# Altium schematic sheet MD040_Motor_control_RevE2.SchDoc
size 431 x 279 mm; Date: Not shown in title block; ApprovedBy: Not shown in title block; CheckedBy: Not shown in title block; Author: Not shown in title block; CompanyName: Not shown in title block; Engineer: Not shown in title block; Organization: Not shown in title block; Address1: Not shown in title block; Address2: Not shown in title block; Address3: Not shown in title block; Address4: Not shown in title block; DocumentNumber: 2; Revision: Use project parameter SCH_Rev; SheetNumber: 2; SheetTotal: 3; PageSetup: Record=PageOptions|CenterHorizontal=True|CenterVertical=True|PrintScale=1.00|XCorrection=1.00|YCorrection=1.00|PrintKind=0|BorderSize=5000000|LeftOffset=0|BottomOffset=0|Orientation=2|PaperLength=1000|PaperWidth=1000|Scale=100|PaperSource=15|PrintQuality=600|MediaType=1|DitherType=10|PaperKind=Letter|PrintScaleMode=1; CurrentTime: Not shown in title block; CurrentDate: Not shown in title block; Time: Not shown in title block; DocumentFullPathAndName: Not shown in title block; DocumentName: Not shown in title block; ModifiedDate: Not shown in title block; ImagePath: Not shown in title block
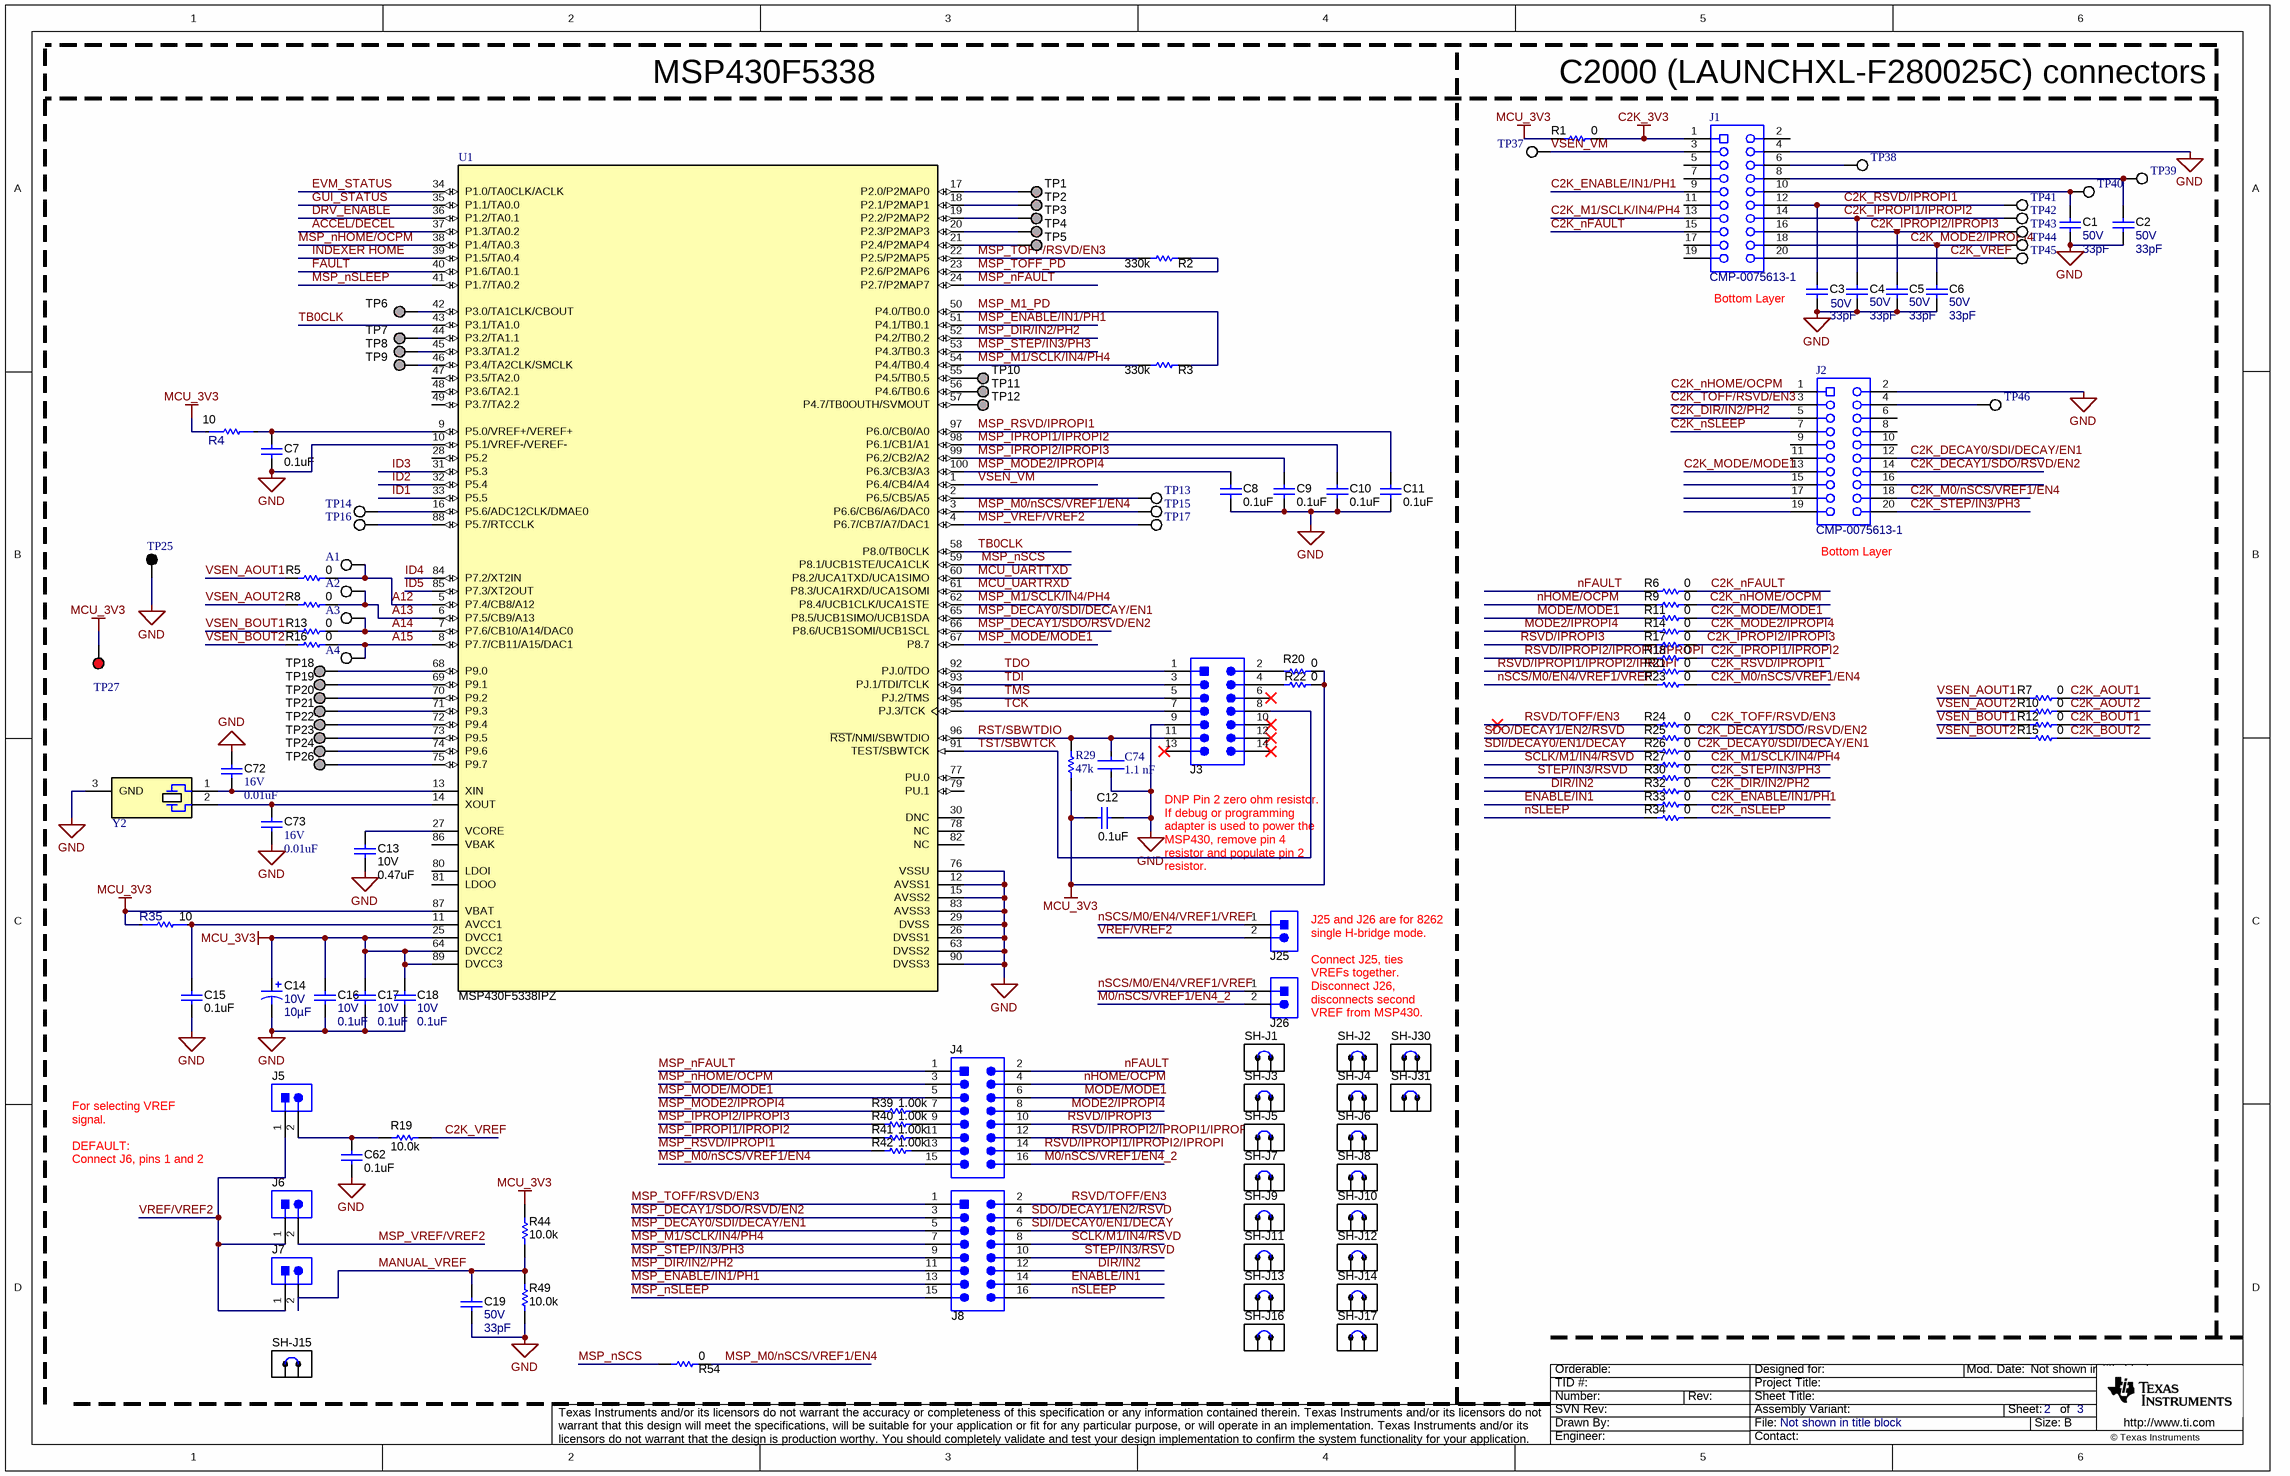
[diagram p0: MD040_Motor_control_RevE2.SchDoc]

## Parts
A1  5012  [Keystone5012]  (value not drawn)
A2  5012  [Keystone5012]  (value not drawn)
A3  5012  [Keystone5012]  (value not drawn)
A4  5012  [Keystone5012]  (value not drawn)
C1  VDC_V: 50V  ValueDisplayed: 33pF  [0402]  (hidden comment: C1005C0G1H330J050BA)
C2  VDC_V: 50V  ValueDisplayed: 33pF  [0402]  (hidden comment: C1005C0G1H330J050BA)
C3  VDC_V: 50V  ValueDisplayed: 33pF  [0402]  (hidden comment: C1005C0G1H330J050BA)
C4  VDC_V: 50V  ValueDisplayed: 33pF  [0402]  (hidden comment: C1005C0G1H330J050BA)
C5  VDC_V: 50V  ValueDisplayed: 33pF  [0402]  (hidden comment: C1005C0G1H330J050BA)
C6  VDC_V: 50V  ValueDisplayed: 33pF  [0402]  (hidden comment: C1005C0G1H330J050BA)
C7  ValueDisplayed: 0.1uF  [0402L]  (hidden comment: 885012105010)
C8  ValueDisplayed: 0.1uF  [0402L]  (hidden comment: 885012105010)
C9  ValueDisplayed: 0.1uF  [0402L]  (hidden comment: 885012105010)
C10  ValueDisplayed: 0.1uF  [0402L]  (hidden comment: 885012105010)
C11  ValueDisplayed: 0.1uF  [0402L]  (hidden comment: 885012105010)
C12  ValueDisplayed: 0.1uF  [0402L]  (hidden comment: 885012105010)
C13  VDC_V: 10V  ValueDisplayed: 0.47uF  [0402]  (hidden comment: GRM155R61A474KE15D)
C14  VDC_V: 10V  ValueDisplayed: 10µF  [3216-18]  (hidden comment: T520A106M010ATE080)
C15  ValueDisplayed: 0.1uF  [0402L]  (hidden comment: 885012105010)
C16  VDC_V: 10V  ValueDisplayed: 0.1uF  [0402]  (hidden comment: GRM155R61A104KA01D)
C17  VDC_V: 10V  ValueDisplayed: 0.1uF  [0402]  (hidden comment: GRM155R61A104KA01D)
C18  VDC_V: 10V  ValueDisplayed: 0.1uF  [0402]  (hidden comment: GRM155R61A104KA01D)
C19  VDC_V: 50V  ValueDisplayed: 33pF  [0402]  (hidden comment: C1005C0G1H330J050BA)
C62  ValueDisplayed: 0.1uF  [0402L]  (hidden comment: 885012105010)
C72  VDC_V: 16V  ValueDisplayed: 0.01uF  [0402]  (hidden comment: 885012205031)
C73  VDC_V: 16V  ValueDisplayed: 0.01uF  [0402]  (hidden comment: 885012205031)
C74  1.1 nF  [FP-C0805C-DN-MFG]
J1  CMP-0075613-1  [Samtec_SSQ-110-03-x-D]
J2  CMP-0075613-1  [Samtec_SSQ-110-03-x-D]
J3  Header_7x2_PEC07DAAN  [CONN_PEC07DAAN]  (value not drawn)
J4  TSM-108-01-L-DV  [Samtec_TSM-108-01-x-DV]  (value not drawn)
J5  PBC02SAAN  [Sullins_PBC02SAAN]  (value not drawn)
J6  PBC02SAAN  [Sullins_PBC02SAAN]  (value not drawn)
J7  PBC02SAAN  [Sullins_PBC02SAAN]  (value not drawn)
J8  TSM-108-01-L-DV  [Samtec_TSM-108-01-x-DV]  (value not drawn)
J25  PBC02SAAN  [Sullins_PBC02SAAN]  (value not drawn)
J26  PBC02SAAN  [Sullins_PBC02SAAN]  (value not drawn)
R1  value 0  [0402L]  (hidden comment: Resistor)
R2  ValueDisplayed: 330k  [0603L]  (hidden comment: CRCW0603330KJNEA)
R3  ValueDisplayed: 330k  [0603L]  (hidden comment: CRCW0603330KJNEA)
R4  Res_ohm: 10  [FP-CH0402-10RJFPT_0402-MFG]  (hidden comment: CH0402-10RJFPT)
R5  value 0  [0402L]  (hidden comment: Resistor)
R6  value 0  [0402L]  (hidden comment: Resistor)
R7  value 0  [0402L]  (hidden comment: Resistor)
R8  value 0  [0402L]  (hidden comment: Resistor)
R9  value 0  [0402L]  (hidden comment: Resistor)
R10  value 0  [0402L]  (hidden comment: Resistor)
R11  value 0  [0402L]  (hidden comment: Resistor)
R12  value 0  [0402L]  (hidden comment: Resistor)
R13  value 0  [0402L]  (hidden comment: Resistor)
R14  value 0  [0402L]  (hidden comment: Resistor)
R15  value 0  [0402L]  (hidden comment: Resistor)
R16  value 0  [0402L]  (hidden comment: Resistor)
R17  value 0  [0402L]  (hidden comment: Resistor)
R18  value 0  [0402L]  (hidden comment: Resistor)
R19  ValueDisplayed: 10.0k  [0603]  (hidden comment: CRCW060310K0FKEA)
R20  value 0  [0402L]  (hidden comment: Resistor)
R21  value 0  [0402L]  (hidden comment: Resistor)
R22  value 0  [0402L]  (hidden comment: Resistor)
R23  value 0  [0402L]  (hidden comment: Resistor)
R24  value 0  [0402L]  (hidden comment: Resistor)
R25  value 0  [0402L]  (hidden comment: Resistor)
R26  value 0  [0402L]  (hidden comment: Resistor)
R27  value 0  [0402L]  (hidden comment: Resistor)
R29  47k  [RESC1005X40X25ML05T10]
R30  value 0  [0402L]  (hidden comment: Resistor)
R32  value 0  [0402L]  (hidden comment: Resistor)
R33  value 0  [0402L]  (hidden comment: Resistor)
R34  value 0  [0402L]  (hidden comment: Resistor)
R35  Res_ohm: 10  [FP-CH0402-10RJFPT_0402-MFG]  (hidden comment: CH0402-10RJFPT)
R39  ValueDisplayed: 1.00k  [0402L]  (hidden comment: CRCW04021K00FKED)
R40  ValueDisplayed: 1.00k  [0402L]  (hidden comment: CRCW04021K00FKED)
R41  ValueDisplayed: 1.00k  [0402L]  (hidden comment: CRCW04021K00FKED)
R42  ValueDisplayed: 1.00k  [0402L]  (hidden comment: CRCW04021K00FKED)
R44  ValueDisplayed: 10.0k  [0603]  (hidden comment: CRCW060310K0FKEA)
R49  ValueDisplayed: 10.0k  [0603]  (hidden comment: CRCW060310K0FKEA)
R54  value 0  [0402L]  (hidden comment: Resistor)
SH-J1  SNT-100-BK-G  [SNT-100-BK-G]  (value not drawn)
SH-J2  SNT-100-BK-G  [SNT-100-BK-G]  (value not drawn)
SH-J3  SNT-100-BK-G  [SNT-100-BK-G]  (value not drawn)
SH-J4  SNT-100-BK-G  [SNT-100-BK-G]  (value not drawn)
SH-J5  SNT-100-BK-G  [SNT-100-BK-G]  (value not drawn)
SH-J6  SNT-100-BK-G  [SNT-100-BK-G]  (value not drawn)
SH-J7  SNT-100-BK-G  [SNT-100-BK-G]  (value not drawn)
SH-J8  SNT-100-BK-G  [SNT-100-BK-G]  (value not drawn)
SH-J9  SNT-100-BK-G  [SNT-100-BK-G]  (value not drawn)
SH-J10  SNT-100-BK-G  [SNT-100-BK-G]  (value not drawn)
SH-J11  SNT-100-BK-G  [SNT-100-BK-G]  (value not drawn)
SH-J12  SNT-100-BK-G  [SNT-100-BK-G]  (value not drawn)
SH-J13  SNT-100-BK-G  [SNT-100-BK-G]  (value not drawn)
SH-J14  SNT-100-BK-G  [SNT-100-BK-G]  (value not drawn)
SH-J15  SNT-100-BK-G  [SNT-100-BK-G]  (value not drawn)
SH-J16  SNT-100-BK-G  [SNT-100-BK-G]  (value not drawn)
SH-J17  SNT-100-BK-G  [SNT-100-BK-G]  (value not drawn)
SH-J30  SNT-100-BK-G  [SNT-100-BK-G]  (value not drawn)
SH-J31  SNT-100-BK-G  [SNT-100-BK-G]  (value not drawn)
TP1  TP_H0.45P0.75  [TP_H045P075]  (value not drawn)  (no BOM)
TP2  TP_H0.45P0.75  [TP_H045P075]  (value not drawn)  (no BOM)
TP3  TP_H0.45P0.75  [TP_H045P075]  (value not drawn)  (no BOM)
TP4  TP_H0.45P0.75  [TP_H045P075]  (value not drawn)  (no BOM)
TP5  TP_H0.45P0.75  [TP_H045P075]  (value not drawn)  (no BOM)
TP6  TP_H0.45P0.75  [TP_H045P075]  (value not drawn)  (no BOM)
TP7  TP_H0.45P0.75  [TP_H045P075]  (value not drawn)  (no BOM)
TP8  TP_H0.45P0.75  [TP_H045P075]  (value not drawn)  (no BOM)
TP9  TP_H0.45P0.75  [TP_H045P075]  (value not drawn)  (no BOM)
TP10  TP_H0.45P0.75  [TP_H045P075]  (value not drawn)  (no BOM)
TP11  TP_H0.45P0.75  [TP_H045P075]  (value not drawn)  (no BOM)
TP12  TP_H0.45P0.75  [TP_H045P075]  (value not drawn)  (no BOM)
TP13  5012  [Keystone5012]  (value not drawn)
TP14  5012  [Keystone5012]  (value not drawn)
TP15  5012  [Keystone5012]  (value not drawn)
TP16  5012  [Keystone5012]  (value not drawn)
TP17  5012  [Keystone5012]  (value not drawn)
TP18  TP_H0.45P0.75  [TP_H045P075]  (value not drawn)  (no BOM)
TP19  TP_H0.45P0.75  [TP_H045P075]  (value not drawn)  (no BOM)
TP20  TP_H0.45P0.75  [TP_H045P075]  (value not drawn)  (no BOM)
TP21  TP_H0.45P0.75  [TP_H045P075]  (value not drawn)  (no BOM)
TP22  TP_H0.45P0.75  [TP_H045P075]  (value not drawn)  (no BOM)
TP23  TP_H0.45P0.75  [TP_H045P075]  (value not drawn)  (no BOM)
TP24  TP_H0.45P0.75  [TP_H045P075]  (value not drawn)  (no BOM)
TP25  5011  [Keystone5011]  (value not drawn)
TP26  TP_H0.45P0.75  [TP_H045P075]  (value not drawn)  (no BOM)
TP27  5010  [Keystone5010]  (value not drawn)
TP37  5012  [Keystone5012]  (value not drawn)
TP38  5012  [Keystone5012]  (value not drawn)
TP39  5012  [Keystone5012]  (value not drawn)
TP40  5012  [Keystone5012]  (value not drawn)
TP41  5012  [Keystone5012]  (value not drawn)
TP42  5012  [Keystone5012]  (value not drawn)
TP43  5012  [Keystone5012]  (value not drawn)
TP44  5012  [Keystone5012]  (value not drawn)
TP45  5012  [Keystone5012]  (value not drawn)
TP46  5012  [Keystone5012]  (value not drawn)
U1  MSP430F5338IPZ  [PZT0100A_N]
Y2  MS3V-T1R 32.768KHZ +/-20PPM 12.5PF  [XTAL_MS3V-T1R]  (value not drawn)

## Nets
C2K_3V3: J1.1 R1.2
GND: C1.2 C2.2 C3.2 C4.2 C5.2 C6.2 C7.1 C8.1 C9.1 C10.1 C11.1 C12.2 C13.2 C14.2(-) C15.1 C16.2 C17.2 C18.2 C19.2 C62.1 C72.2 C73.1 C74.2 J1.4 J2.2 J3.9 R49.1 TP25.1 U1.10(P5.1/VREF-/VEREF-) U1.12(AVSS1) U1.15(AVSS2) U1.26(DVSS1) U1.29(DVSS) U1.63(DVSS2) U1.76(VSSU) U1.83(AVSS3) U1.90(DVSS3) Y2.3(GND)
MCU_3V3: C12.1 C14.1(+) C16.1 C17.1 C18.1 R1.1 R4.1 R20.2 R22.2 R29.1 R35.1 R44.2 TP27.1 U1.25(DVCC1) U1.64(DVCC2) U1.87(VBAT) U1.89(DVCC3)
A12: A1.1 R5.2 U1.5(P7.4/CB8/A12)
A13: A2.1 R8.2 U1.6(P7.5/CB9/A13)
A14: A3.1 R13.2 U1.7(P7.6/CB10/A14/DAC0)
A15: A4.1 R16.2 U1.8(P7.7/CB11/A15/DAC1)
ACCEL/DECEL: U1.37(P1.3/TA0.2)
C2K_AOUT1: R7.2
C2K_AOUT2: R10.2
C2K_BOUT1: R12.2
C2K_BOUT2: R15.2
C2K_DECAY0/SDI/DECAY/EN1: J2.12 R26.2
C2K_DECAY1/SDO/RSVD/EN2: J2.14 R25.2
C2K_DIR/IN2/PH2: J2.5 R32.2
C2K_ENABLE/IN1/PH1: J1.9 R33.2
C2K_IPROPI1/IPROPI2: C4.1 J1.14 R18.2 TP42.1
C2K_IPROPI2/IPROPI3: C5.1 J1.16 R17.2 TP43.1
C2K_M0/nSCS/VREF1/EN4: J2.18 R23.2
C2K_M1/SCLK/IN4/PH4: J1.13 R27.2
C2K_MODE2/IPROPI4: C6.1 J1.18 R14.2 TP44.1
C2K_MODE/MODE1: J2.13 R11.2
C2K_nFAULT: J1.15 R6.2
C2K_nHOME/OCPM: J2.1 R9.2
C2K_nSLEEP: J2.7 R34.2
C2K_RSVD/IPROPI1: C3.1 J1.12 R21.2 TP41.1
C2K_STEP/IN3/PH3: J2.20 R30.2
C2K_TOFF/RSVD/EN3: J2.3 R24.2
C2K_VREF: J1.20 R19.1 TP45.1
DIR/IN2: J8.12 R32.1
DRV_ENABLE: U1.36(P1.2/TA0.1)
ENABLE/IN1: J8.14 R33.1
EVM_STATUS: U1.34(P1.0/TA0CLK/ACLK)
FAULT: U1.40(P1.6/TA0.1)
GUI_STATUS: U1.35(P1.1/TA0.0)
ID1: U1.33(P5.5)
ID2: U1.32(P5.4)
ID3: U1.31(P5.3)
ID4: U1.84(P7.2/XT2IN)
ID5: U1.85(P7.3/XT2OUT)
INDEXER HOME: U1.39(P1.5/TA0.4)
M0/nSCS/VREF1/EN4_2: J4.16 J26.2
MANUAL_VREF: C19.1 J7.2 R44.1 R49.2
MCU_UARTRXD: U1.61(P8.3/UCA1RXD/UCA1SOMI)
MCU_UARTTXD: U1.60(P8.2/UCA1TXD/UCA1SIMO)
MODE2/IPROPI4: J4.8 R14.1
MODE/MODE1: J4.6 R11.1
MSP_DECAY0/SDI/DECAY/EN1: J8.5 U1.65(P8.5/UCB1SIMO/UCB1SDA)
MSP_DECAY1/SDO/RSVD/EN2: J8.3 U1.66(P8.6/UCB1SOMI/UCB1SCL)
MSP_DIR/IN2/PH2: J8.11 U1.52(P4.2/TB0.2)
MSP_ENABLE/IN1/PH1: J8.13 U1.51(P4.1/TB0.1)
MSP_IPROPI1/IPROPI2: C10.2 R41.1 U1.98(P6.1/CB1/A1)
MSP_IPROPI2/IPROPI3: C9.2 R40.1 U1.99(P6.2/CB2/A2)
MSP_M0/nSCS/VREF1/EN4: J4.15 R54.2 TP15.1 U1.3(P6.6/CB6/A6/DAC0)
MSP_M1/SCLK/IN4/PH4: J8.7 R3.1 U1.54(P4.4/TB0.4) U1.62(P8.4/UCB1CLK/UCA1STE)
MSP_M1_PD: R3.2 U1.50(P4.0/TB0.0)
MSP_MODE2/IPROPI4: C8.2 R39.1 U1.100(P6.3/CB3/A3)
MSP_MODE/MODE1: J4.5 U1.67(P8.7)
MSP_nFAULT: J4.1 U1.24(P2.7/P2MAP7)
MSP_nHOME/OCPM: J4.3 U1.38(P1.4/TA0.3)
MSP_nSCS: R54.1 U1.59(P8.1/UCB1STE/UCA1CLK)
MSP_nSLEEP: J8.15 U1.41(P1.7/TA0.2)
MSP_RSVD/IPROPI1: C11.2 R42.1 U1.97(P6.0/CB0/A0)
MSP_STEP/IN3/PH3: J8.9 U1.53(P4.3/TB0.3)
MSP_TOFF/RSVD/EN3: J8.1 R2.1 U1.22(P2.5/P2MAP5)
MSP_TOFF_PD: R2.2 U1.23(P2.6/P2MAP6)
MSP_VREF/VREF2: J6.2 TP17.1 U1.4(P6.7/CB7/A7/DAC1)
nFAULT: J4.2 R6.1
nHOME/OCPM: J4.4 R9.1
nSCS/M0/EN4/VREF1/VREF: J25.1 J26.1 R23.1
nSLEEP: J8.16 R34.1
RST/SBWTDIO: C74.1 J3.11 R29.2 U1.96(~{RST}/NMI/SBWTDIO)
RSVD/IPROPI1/IPROPI2/IPROPI: J4.14 R21.1
RSVD/IPROPI2/IPROPI1/IPROPI: J4.12 R18.1
RSVD/IPROPI3: J4.10 R17.1
RSVD/TOFF/EN3: J8.2 R24.1
SCLK/M1/IN4/RSVD: J8.8 R27.1
SDI/DECAY0/EN1/DECAY: J8.6 R26.1
SDO/DECAY1/EN2/RSVD: J8.4 R25.1
STEP/IN3/RSVD: J8.10 R30.1
TB0CLK: U1.43(P3.1/TA1.0) U1.58(P8.0/TB0CLK)
TCK: J3.7 U1.95(PJ.3/TCK)
TDI: J3.3 U1.93(PJ.1/TDI/TCLK)
TDO: J3.1 U1.92(PJ.0/TDO)
TMS: J3.5 U1.94(PJ.2/TMS)
TST/SBWTCK: J3.8 U1.91(TEST/SBWTCK)
VREF/VREF2: J5.1 J6.1 J7.1 J25.2
VSEN_AOUT1: R5.1 R7.1
VSEN_AOUT2: R8.1 R10.1
VSEN_BOUT1: R12.1 R13.1
VSEN_BOUT2: R15.1 R16.1
VSEN_VM: J1.3 TP37.1 U1.1(P6.4/CB4/A4)
NetC1_1: C1.1 J1.10 TP40.1
NetC2_1: C2.1 J1.8 TP39.1
NetC7_2: C7.2 R4.2 U1.9(P5.0/VREF+/VEREF+)
NetC13_1: C13.1 U1.27(VCORE)
NetC15_2: C15.2 R35.2 U1.11(AVCC1)
NetC62_2: C62.2 J5.2 R19.2
NetC72_1: C72.1 U1.13(XIN) Y2.1
NetC73_2: C73.2 U1.14(XOUT) Y2.2
NetJ1_6: J1.6 TP38.1
NetJ2_4: J2.4 TP46.1
NetJ3_2: J3.2 R20.1
NetJ3_4: J3.4 R22.1
NetJ4_7: J4.7 R39.2
NetJ4_9: J4.9 R40.2
NetJ4_11: J4.11 R41.2
NetJ4_13: J4.13 R42.2
NetTP1_1: TP1.1 U1.17(P2.0/P2MAP0)
NetTP2_1: TP2.1 U1.18(P2.1/P2MAP1)
NetTP3_1: TP3.1 U1.19(P2.2/P2MAP2)
NetTP4_1: TP4.1 U1.20(P2.3/P2MAP3)
NetTP5_1: TP5.1 U1.21(P2.4/P2MAP4)
NetTP6_1: TP6.1 U1.42(P3.0/TA1CLK/CBOUT)
NetTP7_1: TP7.1 U1.44(P3.2/TA1.1)
NetTP8_1: TP8.1 U1.45(P3.3/TA1.2)
NetTP9_1: TP9.1 U1.46(P3.4/TA2CLK/SMCLK)
NetTP10_1: TP10.1 U1.55(P4.5/TB0.5)
NetTP11_1: TP11.1 U1.56(P4.6/TB0.6)
NetTP12_1: TP12.1 U1.57(P4.7/TB0OUTH/SVMOUT)
NetTP13_1: TP13.1 U1.2(P6.5/CB5/A5)
NetTP14_1: TP14.1 U1.16(P5.6/ADC12CLK/DMAE0)
NetTP16_1: TP16.1 U1.88(P5.7/RTCCLK)
NetTP18_1: TP18.1 U1.68(P9.0)
NetTP19_1: TP19.1 U1.69(P9.1)
NetTP20_1: TP20.1 U1.70(P9.2)
NetTP21_1: TP21.1 U1.71(P9.3)
NetTP22_1: TP22.1 U1.72(P9.4)
NetTP23_1: TP23.1 U1.73(P9.5)
NetTP24_1: TP24.1 U1.74(P9.6)
NetTP26_1: TP26.1 U1.75(P9.7)

Not connected (* = marked no-connect by the designer): J1 2 5 7 11 17 19; J2 6 8 9 10 11 15 16 17 19; J3 6* 10* 12* 13* 14*; U1 28(P5.2) 30(DNC) 47(P3.5/TA2.0) 48(P3.6/TA2.1) 49(P3.7/TA2.2) 77(PU.0) 78(NC) 79(PU.1) 80(LDOI) 81(LDOO) 82(NC) 86(VBAK)

## Notes on the sheet
- MSP430F5338
- C2000 (LAUNCHXL-F280025C) connectors
- Bottom Layer
- (near J2) Bottom Layer
- DNP Pin 2 zero ohm resistor. If debug or programming adapter is used to power the MSP430, remove pin 4 resistor and populate pin 2 resistor.
- J25 and J26 are for 8262 single H-bridge mode.
  Connect J25, ties VREFs together. Disconnect J26, disconnects second VREF from MSP430.
- For selecting VREF signal.
  DEFAULT:
  Connect J6, pins 1 and 2
- Drawn By:
- SVN Rev:
- Number:
- TID #:
- Orderable:
- Rev:
- Sheet Title:
- File:
- Project Title:
- Designed for:
- Assembly Variant:
- Mod. Date:
- Sheet:
- Size:
- of
- B
- http://www.ti.com
- Texas Instruments and/or its licensors do not warrant the accuracy or completeness of this specification or any information contained therein. Texas Instruments and/or its licensors do not warrant that this design will meet the specifications, will be suitable for your application or fit for any particular purpose, or will operate in an implementation. Texas Instruments and/or its licensors do not warrant that the design is production worthy. You should completely validate and test your design implementation to confirm the system functionality for your application.
- Engineer:
- Contact:
- © Texas Instruments

## Library data of the parts
A1-A4 TP13-TP17 TP37-TP46 = CMP-0055149-1: Test Point, Multipurpose, White, TH; Manufacturer: Keystone; CNHeader: FALSE; Green_Lifecycle: Active; Green_REACh: Passed; ContactFinish: Silver; CT: TRUE; ComponentLink1URL: http://www.keyelco.com/userAssets/file/M60-2p60.pdf; Supplier Part Number 2: 534-5012; Publisher: Texas Instruments; Supplier 2: Mouser; Color: White; RoHS: Y; MountType: TH; Green_EU RoHS-2: Incomplete; Supplier 1: Digi-Key; Green_EU RoHS: Passed; PackageReference: White Multipurpose Testpoint; CompType: Test Point; LatestRevisionDate: 26/05/2017; PartNumber: 5012; ComponentLink1Description: Datasheet URL; Supplier Part Number 1: 36-5012-ND
C1-C6 C19 = CMP-0006250-2: CAP, CERM, 33 pF, 50 V, +/- 5%, C0G/NP0, 0402; Manufacturer: TDK; TaMin_C: -55°C; Polarized: N; SizeAreaWB_mm2: 3; Value1: Unknown; U/M: EA; Value: 33pF; TaMax_C: 125°C; SizeZ_mm: 0.6; SizeX_mm: 1; SizeY_mm: 0.5; AEC Category: Q200; Supplier Part Number 2: 72W1722; Publisher: Texas Instruments; Supplier 2: Newark; Supplier Part Number 3: 810-C1005C0G1H330J; TempCo: C0G/NP0; Supplier 3: Mouser; Published: 2008-06-19; RoHS: Y; MountType: SMT; Supplier 1: Digi-Key; PackageReference: 0402; Tolerance_%: 5%; Cap_Case: 0402; Value2: 50V; SizeArea_mm2: 0.5; CompType: Capacitor; LatestRevisionDate: 2017-03-09; PartNumber: C1005C0G1H330J050BA; AEC Qualified: ?; Cap_F: 33pF; ComponentLink1Description: Datasheet link; Supplier Part Number 1: 445-1241-1-ND; Technology: Ceramic; ComponentLink1URL: http://product.tdk.com/en/catalog/datasheets/mlcc_commercial_general_en.pdf
C7-C12 C15 C62 = CMP-0006221-1: CAP, CERM, 0.1 uF, 10 V, +/- 20%, X5R, 0402; Manufacturer: Wurth Elektronik; Value: 0.1uF; Polarized: N; U/M: EA; Cap_F: 100nF; Value1: Unknown; VDC_V: 10V; TaMin_C: -55°C; TaMax_C: 85°C; Cap_Case: 0402; AEC Category: Q200; SizeArea_mm2: 0.5; SizeAreaWB_mm2: 3; SizeX_mm: 1; SizeZ_mm: 0.6; CompType: Capacitor; PartNumber: 885012105010; PackageReference: 0402; RoHS: Y; Tolerance_%: 20%; Value2: 10V; MountType: SMT; Technology: Ceramic; TempCo: X5R; Published: 2008-06-19; Publisher: Texas Instruments; LatestRevisionDate: 2017-03-09; ComponentLink1Description: Datasheet link; ComponentLink1URL: http://katalog.we-online.de/pbs/datasheet/885012105010.pdf; Supplier 1: Digi-Key; Supplier Part Number 1: 732-7487-1-ND; Supplier 2: Mouser; Supplier Part Number 2: 710-885012105010; AEC Grade: N/A; AEC Qualified: N; SizeY_mm: 0.5
C13 = CMP-0006580-1: CAP, CERM, 0.47 uF, 10 V, +/- 10%, X5R, 0402; Manufacturer: MuRata; TaMin_C: -55°C; Polarized: N; SizeAreaWB_mm2: 3; Value1: Unknown; U/M: EA; Value: 0.47uF; TaMax_C: 85°C; SizeZ_mm: 0.6; SizeX_mm: 1; SizeY_mm: 0.5; Cap_F: 470nF; AEC Category: Q200; ComponentLink1URL: http://search.murata.co.jp/Ceramy/PnsearchViewAction.do?HnOFG=ON&HnNFG=ON&SEL_CNT=50&sLang=en&sKey=GRM155R61A474KE15D&x=9&y=9&search=startwith; Supplier Part Number 2: 14T3277; Publisher: Texas Instruments; Supplier 2: Newark; TempCo: X5R; Supplier 3: Mouser; Published: 2008-06-19; RoHS: Y; MountType: SMT; Supplier 1: Digi-Key; PackageReference: 0402; Tolerance_%: 10%; Supplier Part Number 3: 81-GRM155R61A474KE5D; Cap_Case: 0402; Value2: 10V; SizeArea_mm2: 0.5; CompType: Capacitor; LatestRevisionDate: 2017-03-09; PartNumber: GRM155R61A474KE15D; AEC Qualified: ?; ComponentLink1Description: Datasheet link; Supplier Part Number 1: 490-3264-1-ND; Technology: Ceramic
C14 = CMP-0084376-1: CAP, Tantalum Polymer, 10 µF, 10 V,+/- 20%, 0.08 ohm, 3216-18 SMD; Manufacturer: Kemet; TaMin_C: -55°C; SizeArea_mm2: 5.12; Value: 10uF; SizeAreaWB_mm2: 10.92; SizeY_mm: 1.6; Polarized: Y; SizeX_mm: 3.2; AEC Qualified: N; TaMax_C: 105°C; SizeZ_mm: 1.8; ESR_ohm: 0.08; CompType: Capacitor; AEC Category: Q200; PackageReference: 3216-18; Technology: Tantalum Polymer; Cap_Case: 3216-18; ComponentLink1URL: https://content.kemet.com/datasheets/KEM_T2076_T52X-530.pdf; ComponentLink1Description: Datasheet link; PartNumber: T520A106M010ATE080; Value1: 0.08 ohm; MountType: SMT; Value2: 10V; Cap_F: 10µF; RoHS: Y; Series: T520; Tolerance_%: 20%; AEC Grade: N/A
C16-C18 = CMP-0006562-2: CAP, CERM, 0.1 uF, 10 V, +/- 10%, X5R, 0402; Manufacturer: MuRata; TaMin_C: -55°C; Polarized: N; SizeAreaWB_mm2: 3; Value1: Unknown; U/M: EA; Value: 0.1uF; TaMax_C: 85°C; SizeZ_mm: 0.6; SizeX_mm: 1; SizeY_mm: 0.5; Cap_F: 100nF; AEC Category: Q200; ComponentLink1URL: http://search.murata.co.jp/Ceramy/PnsearchViewAction.do?HnOFG=ON&HnNFG=ON&SEL_CNT=50&sLang=en&sKey=GRM155R61A104KA01D&x=9&y=9&search=startwith; Supplier Part Number 2: 81-GRM155R61A104KA01; Publisher: Texas Instruments; Supplier 2: Mouser; Supplier Part Number 3: 1828862; TempCo: X5R; Supplier 3: Farnell; Published: 2008-06-19; RoHS: Y; MountType: SMT; Supplier 1: Digi-Key; PackageReference: 0402; Tolerance_%: 10%; Cap_Case: 0402; Value2: 10V; SizeArea_mm2: 0.5; CompType: Capacitor; LatestRevisionDate: 2017-03-09; PartNumber: GRM155R61A104KA01D; AEC Qualified: ?; ComponentLink1Description: Datasheet link; Supplier Part Number 1: 490-1318-1-ND; Technology: Ceramic
C72 C73 = CMP-0006227-2: CAP, CERM, 0.01 uF, 16 V, +/- 10%, X7R, 0402; Manufacturer: Wurth Elektronik; TaMin_C: -55°C; Polarized: N; SizeAreaWB_mm2: 3; Value1: Unknown; U/M: EA; Value: 0.01uF; TaMax_C: 125°C; SizeZ_mm: 0.6; SizeX_mm: 1; SizeY_mm: 0.5; Cap_F: 10nF; AEC Category: Q200; Publisher: Texas Instruments; TempCo: X7R; Published: 2008-06-19; RoHS: Y; MountType: SMT; Supplier 1: Mouser; PackageReference: 0402; Tolerance_%: 10%; Cap_Case: 0402; Value2: 16V; SizeArea_mm2: 0.5; CompType: Capacitor; LatestRevisionDate: 2017-03-09; PartNumber: 885012205031; AEC Qualified: N; ComponentLink1Description: Datasheet link; AEC Grade: N/A; Supplier Part Number 1: 710-885012205031; Technology: Ceramic; ComponentLink1URL: http://katalog.we-online.de/pbs/datasheet/885012205031.pdf
C74 = CMP-1036-03017-2: CAP CER 1100PF 50V NP0 0805; Manufacturer: KEMET; Manufacturer Part Number: C0805C112F5GACTU; Value: 1,100 pF; Tolerance: 0.01; Material: Ceramic; Temperature Characteristic: C0G; Temperature Coefficient: 30ppm/°C; Lead Free: Yes; RoHS: TRUE; Package: C0805C-DN; ComponentLink2Description: Datasheet; Category: Cap; Digikey Description: CAP CER 1100PF 50V NP0 0805; Temperature Range Low: -55°C; Device Class L1: Passive Components; ComponentLink2URL: https://content.kemet.com/datasheets/KEM_C1003_C0G_SMD.pdf; Temperature Range High: +125°C; Mouser Description: Multilayer Ceramic Capacitors MLCC - SMD/SMT 50volts 1100pF C0G 1%; Capacitance: 1,100 pF; Device Class L2: Capacitors; Temperature: -55°C to +125°C; Height: 0.88mm; Octopart: https://octopart.com/c0805c112f5gactu-kemet-19050258; Ipc Land Pattern Name: CAPC200125X78; Automotive: No; Device Class L3: Ceramic Capacitors; Voltage Rating: 50 V
J1 J2 = CMP-0075613-1: Receptacle, 2.54mm, 10x2, Gold, TH; PartNumber: SSQ-110-03-G-D; Manufacturer: Samtec; CompType: Socket Strip; Pitch_mm: 2.54; Gender: Female; Row_Count: 2; Current_A: 6.3A; Voltage_V: 550V; Cert_CSA: Y; Cert_CULUS: N; CT: True; CNHeader: False; PackageReference: Receptacle, 2.54mm, 10x2, TH; RoHS: Y; MountType: TH; ComponentLink1Description: Datasheet URL; ComponentLink1URL: https://www.samtec.com/ftppub/cpdf/SSQ-1XX-XX-XXX-X-XX-XXX-XX-X-MKT.pdf; Orientation: Vertical; PinCount: 20; RowSpacing_mm: 2.54; ContactFinish: Gold; Color: Black; Cert_UL: Y; Cert_VDE: N; Publisher: Texas Instruments; LatestRevisionDate: 2017-07-12
J3 = CMP-0002339-2: Header, 100mil, 7x2, Tin, TH; Manufacturer: Sullins Connector Solutions; Cert_UL: Y; Current_A: 3A; Gender: Male; Green_Lifecycle: Active; Green_REACh: Passed; Pitch_mm: 2.54; Row_Count: 2; Shrouded: N; Voltage_V: 1.8kV; PartNumber: PEC07DAAN; PackageReference: Header, 7x2, 100mil, Tin; CompType: Header; RoHS: Y; MountType: TH; ComponentLink1Description: Datasheet URL; ComponentLink1URL: http://www.sullinscorp.com/catalogs/77_PAGE108-109_.100_MALE_HDR.pdf; Supplier 1: Digi-Key; Supplier Part Number 1: S2012E-07-ND; ClassName: Header; Color: Black; ContactFinish: Tin; Green_EU RoHS-2: Passed; Green_EU RoHS: Passed; Orientation: Vertical; PinCount: 14; RowSpacing_mm: 2.54
J4 J8 = CMP-0075595-1: Header, 2.54mm, 8x2, Gold, SMT; Manufacturer: Samtec; Pitch_mm: 2.54; Gender: Male; Cert_CSA: Y; Current_A: 4.9A; Voltage_V: 475V; CT: False; Shrouded: N; Row_Count: 2; CNHeader: True; ComponentLink1Description: Datasheet URL; RoHS: Y; Supplier Part Number 3: 2308473; Supplier 1: Digi-Key; Cert_UL: Y; Orientation: Vertical; PackageReference: Header, 2.54mm, 8x2, SMT; Color: Black; PartNumber: TSM-108-01-L-DV; PinCount: 16; Publisher: Texas Instruments; Supplier Part Number 2: 97B2917; ContactFinish: Gold; Supplier 2: Newark; ClassName: Header; RowSpacing_mm: 2.54; ComponentLink1URL: https://www.samtec.com/ftppub/cpdf/TSM-1XX-XX-XXX-XX-X-XXX-X-MKT.pdf; LatestRevisionDate: 2017-07-12; CompType: Header; MountType: SMT; Supplier Part Number 1: SAM8884-ND; Supplier 3: Farnell
J5-J7 J25 J26 = CMP-0054566-1: Header, 100mil, 2x1, Gold, TH; Manufacturer: Sullins Connector Solutions; CNHeader: TRUE; Current_A: 3A; Green_Lifecycle: Active; Shrouded: N; Gender: Male; Green_REACh: Passed; Voltage_V: 1.8kV; Row_Count: 1; Pitch_mm: 2.54; CT: FALSE; Cert_UL: Y; ComponentLink1URL: http://www.sullinscorp.com/catalogs/77_PAGE108-109_.100_MALE_HDR.pdf; ClassName: Header; Publisher: Texas Instruments; Color: Black; RoHS: Y; MountType: TH; Green_EU RoHS-2: Passed; Supplier 1: Digi-Key; Green_EU RoHS: Passed; PackageReference: Sullins 100mil, 1x2, 230 mil above insulator; PinCount: 2; CompType: Header; LatestRevisionDate: 26/05/2017; PartNumber: PBC02SAAN; Orientation: Vertical; ComponentLink1Description: Datasheet URL; Supplier Part Number 1: S1011E-02-ND; ContactFinish: Gold
R1 R5-R18 R20-R27 R30 R32-R34 R54 = CMP-0026992-3: RES, 0, 5%, 0.1 W, AEC-Q200 Grade 0, 0402; Manufacturer: Panasonic; PartNumber: ERJ-2GE0R00X; Value_Code: 0000; Power_W: 100mW; Value2: 0.1W; VDC_V: 50V; TempCo: 600 ppm/C; EIA_Code: E24; AEC Category: Q200; AEC Qualified: Y; SizeArea_mm2: 0.5; SizeAreaWB_mm2: 3; SizeX_mm: 1; SizeZ_mm: 0.6; CompType: Resistor; PackageReference: 0402; RoHS: Y; Res_ohm: 0; Tolerance_%: 5%; Value1: 5%; MountType: SMT; Technology: Thick Film; ComponentLink1Description: Datasheet link; ComponentLink1URL: https://industrial.panasonic.com/cdbs/www-data/pdf/RDA0000/AOA0000C301.pdf; Supplier 1: Digi-Key; Supplier Part Number 1: P0.0JCT-ND; Supplier 2: Newark; Supplier Part Number 2: 65T8307; Supplier 3: Mouser; Supplier Part Number 3: 667-ERJ-2GE0R00X; AEC Grade: 0; SizeY_mm: 0.5; ValueDisplayed: 0
R2 R3 = CMP-0025784-3: RES, 330 k, 5%, 0.1 W, 0603; Manufacturer: Vishay-Dale; Power_W: 100mW; TempCo: 200 ppm/C; U/M: EA; Value: 330k; EIA_Code: E24; SizeX_mm: 1.6; SizeY_mm: 0.8; SizeZ_mm: 1; Value2: 0.1W; SizeArea_mm2: 1.28; VDC_V: 75V; AEC Category: Q200; Supplier Part Number 2: 59M6804; Publisher: Texas Instruments; Supplier 2: Newark; Supplier Part Number 3: 71-CRCW0603J-330K-E3; Supplier 3: Mouser; Published: 2008-06-26; Value_Code: 330k; RoHS: Y; Value1: 5%; MountType: SMT; Supplier 1: Digi-Key; PackageReference: 0603; Tolerance_%: 5%; Res_ohm: 330k; CompType: Resistor; LatestRevisionDate: 2017-03-09; PartNumber: CRCW0603330KJNEA; AEC Qualified: ?; ComponentLink1Description: Datasheet link; Supplier Part Number 1: 541-330KGCT-ND; Technology: Thick Film; ComponentLink1URL: http://www.vishay.com/docs/20035/dcrcwe3.pdf
R4 R35 = CMP-0091848-1: 10 Ohms ±5% 0.05W, 1/20W Chip Resistor 0402 (1005 Metric) RF, High Frequency Thin Film; Manufacturer: Vishay; SizeZ_mm: 0.627mm; VDC_V: 37V; TempCo: 100ppm/°C; Power_W: 50mW; AEC Qualified: No; Value: 10; Digikey Part Number: 716-CH0402-10RJFPTCT-ND; ComponentLink1URL: https://www.vishay.com/docs/53014/ch.pdf; Lead Free: Yes; Datasheet Path: datasheets/Res-CH0402-10RJFPT.pdf; ComponentLink1Description: Datasheet; Supplier 1: Digikey; PartNumber: CH0402-10RJFPT; Part Number: CH0402-10RJFPT; PackageReference: 0402; Mouser Description: High Frequency/RF Resistors 50mWatt 10ohms 5% Flip Chip; RoHS: TRUE; Mouser Part Number: 71-CH0402-10RJFPT; datasheet: https://www.vishay.com/docs/53014/ch.pdf; Tolerance_%: 5%; Series: CH; Supplier 2: Mouser; Technology: Thin Film; Digikey Description: RES CH 0402 THIN FILM; Operating Temperature Range: -55°C to +155°C; Supplier Part Number 2: 71-CH0402-10RJFPT; Supplier Part Number 1: 716-CH0402-10RJFPTCT-ND; helpURL: https://upverter.com/upn/revision/6d0c3c4c3a52dca5/; Parameter 1: *
R19 R44 R49 = CMP-0021998-3: RES, 10.0 k, 1%, 0.1 W, 0603; Manufacturer: Vishay-Dale; Power_W: 100mW; TempCo: 100 ppm/C; Value_Code: 10k0; U/M: EA; Value: 10.0k; EIA_Code: E96; Res_ohm: 10k; SizeX_mm: 1.6; SizeY_mm: 0.8; SizeZ_mm: 1; Value2: 0.1W; SizeArea_mm2: 1.28; VDC_V: 75V; AEC Category: Q200; Supplier Part Number 2: 52K8062; Publisher: Texas Instruments; Supplier 2: Newark; Supplier Part Number 3: 71-CRCW0603-10K-E3; Supplier 3: Mouser; Published: 2008-06-26; RoHS: Y; Value1: 1%; MountType: SMT; Supplier 1: Digi-Key; PackageReference: 0603; Tolerance_%: 1%; CompType: Resistor; LatestRevisionDate: 2017-03-09; PartNumber: CRCW060310K0FKEA; AEC Qualified: ?; ComponentLink1Description: Datasheet link; Supplier Part Number 1: 541-10.0KHCT-ND; Technology: Thick Film; ComponentLink1URL: http://www.vishay.com/docs/20035/dcrcwe3.pdf
R29 = CMP-2002-07701-1: Part Number: RC0402FR-0747KL; Manufacturer: Yageo / Phycomp
R39-R42 = CMP-0026071-2: RES, 1.00 k, 1%, 0.063 W, 0402; Manufacturer: Vishay-Dale; Power_W: 63mW; TempCo: 100 ppm/C; Value_Code: 1k00; U/M: EA; Value: 1.00k; EIA_Code: E96; Res_ohm: 1k; SizeX_mm: 1; SizeY_mm: 0.5; SizeZ_mm: 0.6; Value2: 0.063W; VDC_V: 50V; AEC Category: Q200; Supplier Part Number 2: 52K6545; Publisher: Texas Instruments; Supplier 2: Newark; Supplier Part Number 3: 71-CRCW0402-1.0K-E3; Supplier 3: Mouser; Published: 2008-06-26; RoHS: Y; Value1: 1%; MountType: SMT; Supplier 1: Digi-Key; PackageReference: 0402; Tolerance_%: 1%; SizeArea_mm2: 0.5; CompType: Resistor; LatestRevisionDate: 2017-03-09; PartNumber: CRCW04021K00FKED; AEC Qualified: ?; ComponentLink1Description: Datasheet link; Supplier Part Number 1: 541-1.00KLCT-ND; Technology: Thick Film; ComponentLink1URL: http://www.vishay.com/docs/20035/dcrcwe3.pdf
SH-J1-SH-J17 SH-J30 SH-J31 = CMP-0003623-1: Shunt, 100mil, Gold plated, Black; Alternate PartNumber: 969102-0000-DA; Manufacturer: Samtec; Alternate Manufacturer: 3M; Value: 1x2; ComponentLink1URL: http://www.samtec.com/ftppub/pdf/SNT.PDF; Key: SNT-100-BK-G; Publisher: Texas Instruments; Supplier 1: Digi-Key; CompType: Shunt; PackageReference: Shunt; LatestRevisionDate: 2017-03-09; ClassName: Shunt; RoHS: Y; Supplier Part Number 1: SNT-100-BK-G-ND; MountType: N/A; PartNumber: SNT-100-BK-G; ComponentLink1Description: Datasheet Link
TP1-TP12 TP18-TP24 TP26 = CMP-0003719-1: Testpoint; Manufacturer: Texas Instruments; CompType: Pad; ComponentLink1URL: https://sps06.itg.ti.com/sites/KMS/crossdivteams/altium/docs/ComponentDatasheets/testpin with 750um Padsice and 450um drillhole.pdf; Key: TP_H0.45P0.75; Publisher: Texas Instruments; PackageReference: Test Point, 0.45mm hole size; LatestRevisionDate: 2017-03-09; MountType: TH; PartNumber: TP_H0.45P0.75; ComponentLink1Description: Datasheet Link
TP25 = CMP-0055148-1: Test Point, Multipurpose, Black, TH; Manufacturer: Keystone; CNHeader: FALSE; Green_Lifecycle: Active; Green_REACh: Passed; ContactFinish: Silver; CT: TRUE; ComponentLink1URL: http://www.keyelco.com/userAssets/file/M60-2p60.pdf; Supplier Part Number 2: 534-5011; Publisher: Texas Instruments; Supplier 2: Mouser; Color: Black; RoHS: Y; MountType: TH; Green_EU RoHS-2: Incomplete; Supplier 1: Digi-Key; Green_EU RoHS: Passed; PackageReference: Black Multipurpose Testpoint; CompType: Test Point; LatestRevisionDate: 26/05/2017; PartNumber: 5011; ComponentLink1Description: Datasheet URL; Supplier Part Number 1: 36-5011-ND
TP27 = CMP-0055147-1: Test Point, Multipurpose, Red, TH; Manufacturer: Keystone; CNHeader: FALSE; Green_Lifecycle: Active; Green_REACh: Passed; ContactFinish: Silver; CT: TRUE; ComponentLink1URL: http://www.keyelco.com/userAssets/file/M60-2p60.pdf; Supplier Part Number 2: 534-5010; Publisher: Texas Instruments; Supplier 2: Mouser; Color: Red; RoHS: Y; MountType: TH; Green_EU RoHS-2: Incomplete; Supplier 1: Digi-Key; Green_EU RoHS: Passed; PackageReference: Red Multipurpose Testpoint; CompType: Test Point; LatestRevisionDate: 26/05/2017; PartNumber: 5010; ComponentLink1Description: Datasheet URL; Supplier Part Number 1: 36-5010-ND
U1 = CMP-0038879-1: 20 MHz Mixed Signal Microcontroller with 256 KB Flash, 18432 B SRAM and 74 GPIOs, -40 to 85 degC, 100-pin QFP (PZ), Green (RoHS & no Sb/Br); Manufacturer: Texas Instruments; Flash(KB): 256; USCI_B (I2C & SPI): 2; ADC Channels: 16; Comparators: Yes; Frequency(MHz): 20; DMA: 3; SRAM(B): 18432; Multiplier: 32x32; GPIO: 74; Timers - 16-bit: 4; SubFamily: 5 Series; ADC: 12-bit SAR; ComponentLink3URL: http://www.ti.com/lit/ml/mtqf013a/mtqf013a.pdf; DatasheetVersion: SLAS721B; ComponentLink2Description: Datasheet; DAC: 2; ComponentLink2URL: http://www.ti.com/general/docs/lit/getliterature.tsp?genericPartNumber=MSP430F5338&fileType=pdf; PartNumber: MSP430F5338IPZ; Eco-Plan: Green (RoHS & no Sb/Br); Watchdog: Yes; Brown Out Reset: Yes; Real-Time Clock: Yes; ComponentLink3Description: Package Specification; ComponentLink1Description: Manufacturer URL; Code_JEDEC: MS-026; Temp Sensor: Yes; Mounting Technology: Surface Mount; PackageReference: PZT0100A; PackageVersion: 4040149/B; PackageDescription: 100-Pin Plastic Flat Pack, Body 14 x 14 mm, Pitch 0.5 mm; USCI_A (UART/LIN/IrDA/SPI): 2; SVS: Yes; ComponentLink1URL: http://www.ti.com/
Y2 = CMP-0004566-4: Crystal, 32.768 kHz, 12.5pF, SMD; Manufacturer: Micro Crystal AG; TaMin_C: -40°C; TaMax_C: 85°C; AEC Category: Q200; AEC Qualified: N; Frequency Tolerance: 20 ppm; Supplier Part Number 2: 1539368; Supplier 2: Farnell; RoHS: Y; MountType: SMT; Frequency_Fixed: 32.768kHz; Supplier 1: Newark; PackageReference: 1.4x1.4x5.0mm SMD; CompType: Crystal; PartNumber: MS3V-T1R 32.768KHZ +/-20PPM 12.5PF; ComponentLink1Description: Datasheet Link; Supplier Part Number 1: 94M8466; ComponentLink1URL: http://www.microcrystal.com/images/_Product-Documentation/03_TF_metal_Packages/02_Crystal_Documentation/MS3V-T1R_Product-Doc.pdf; AEC Grade: N/A; Load Capacitance: 12.5 pF; REACh: Y